# Altium schematic sheet SchematicFinal.SchDoc
size A4; SheetNumber: 1; SheetTotal: 2
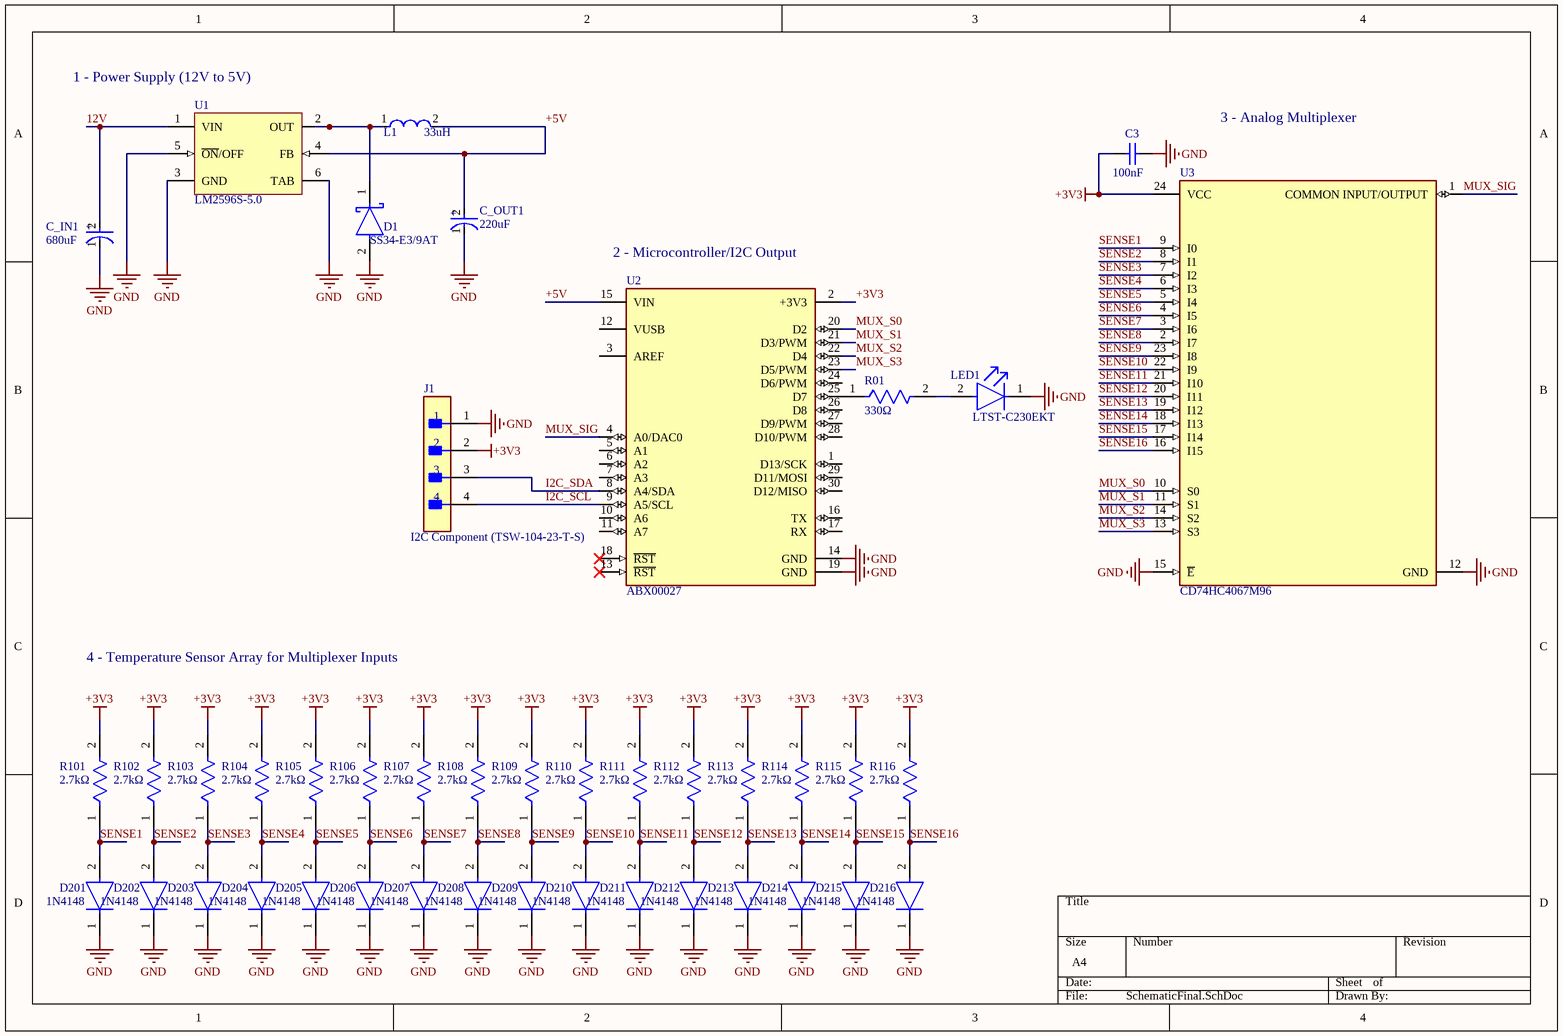
[diagram p0: SchematicFinal.SchDoc]

## Parts
C3  100nF  [CAPC1206(3216)170_M]
C_IN1  680uF  [FP-RAD-TH-D_10_0_5-L_12_5-MFG]
C_OUT1  220uF  [FP-227AVG035MFBJ-MFG]
D1  SS34-E3/9AT  [FP-SMC-MFG]
D201  1N4148  [FP-017AG-MFG]
D202  1N4148  [FP-017AG-MFG]
D203  1N4148  [FP-017AG-MFG]
D204  1N4148  [FP-017AG-MFG]
D205  1N4148  [FP-017AG-MFG]
D206  1N4148  [FP-017AG-MFG]
D207  1N4148  [FP-017AG-MFG]
D208  1N4148  [FP-017AG-MFG]
D209  1N4148  [FP-017AG-MFG]
D210  1N4148  [FP-017AG-MFG]
D211  1N4148  [FP-017AG-MFG]
D212  1N4148  [FP-017AG-MFG]
D213  1N4148  [FP-017AG-MFG]
D214  1N4148  [FP-017AG-MFG]
D215  1N4148  [FP-017AG-MFG]
D216  1N4148  [FP-017AG-MFG]
J1  I2C Component (TSW-104-23-T-S)  [FP-TSW-104-23-T-S-MFG]
L1  33uH  [FP-LB2016-1_6-0_2-IPC_B]
LED1  LTST-C230EKT  [FP-LTST-C230EKT-MFG]
R01  330Ω  [FP-AF0201-MFG]
R101  2.7kΩ  [FP-RT0603-MFG]
R102  2.7kΩ  [FP-RT0603-MFG]
R103  2.7kΩ  [FP-RT0603-MFG]
R104  2.7kΩ  [FP-RT0603-MFG]
R105  2.7kΩ  [FP-RT0603-MFG]
R106  2.7kΩ  [FP-RT0603-MFG]
R107  2.7kΩ  [FP-RT0603-MFG]
R108  2.7kΩ  [FP-RT0603-MFG]
R109  2.7kΩ  [FP-RT0603-MFG]
R110  2.7kΩ  [FP-RT0603-MFG]
R111  2.7kΩ  [FP-RT0603-MFG]
R112  2.7kΩ  [FP-RT0603-MFG]
R113  2.7kΩ  [FP-RT0603-MFG]
R114  2.7kΩ  [FP-RT0603-MFG]
R115  2.7kΩ  [FP-RT0603-MFG]
R116  2.7kΩ  [FP-RT0603-MFG]
U1  LM2596S-5.0  [KTT0005B_L]
U2  ABX00027  [FP-ABX00027-MFG]
U3  CD74HC4067M96  [FP-DW0024A-MFG]

## Nets
+3V3: C3.1 J1.2 R101.2 R102.2 R103.2 R104.2 R105.2 R106.2 R107.2 R108.2 R109.2 R110.2 R111.2 R112.2 R113.2 R114.2 R115.2 R116.2 U2.2(+3V3) U3.24(VCC)
GND: C3.2 C_IN1.1(C) C_OUT1.1(C) D1.2(A) D201.1(C) D202.1(C) D203.1(C) D204.1(C) D205.1(C) D206.1(C) D207.1(C) D208.1(C) D209.1(C) D210.1(C) D211.1(C) D212.1(C) D213.1(C) D214.1(C) D215.1(C) D216.1(C) J1.1 LED1.1(C) U1.3(GND) U1.5(~{ON}/OFF) U1.6(TAB) U2.14(GND) U2.19(GND) U3.12(GND) U3.15(~{E})
12V: C_IN1.2(A) U1.1(VIN)
+5V: C_OUT1.2(A) L1.2 U1.4(FB) U2.15(VIN)
I2C_SCL: J1.4 U2.9(A5/SCL)
I2C_SDA: J1.3 U2.8(A4/SDA)
MUX_S0: U2.20(D2) U3.10(S0)
MUX_S1: U2.21(D3/PWM) U3.11(S1)
MUX_S2: U2.22(D4) U3.14(S2)
MUX_S3: U2.23(D5/PWM) U3.13(S3)
MUX_SIG: U2.4(A0/DAC0) U3.1(COMMON_INPUT/OUTPUT)
SENSE1: D201.2(A) R101.1 U3.9(I0)
SENSE2: D202.2(A) R102.1 U3.8(I1)
SENSE3: D203.2(A) R103.1 U3.7(I2)
SENSE4: D204.2(A) R104.1 U3.6(I3)
SENSE5: D205.2(A) R105.1 U3.5(I4)
SENSE6: D206.2(A) R106.1 U3.4(I5)
SENSE7: D207.2(A) R107.1 U3.3(I6)
SENSE8: D208.2(A) R108.1 U3.2(I7)
SENSE9: D209.2(A) R109.1 U3.23(I8)
SENSE10: D210.2(A) R110.1 U3.22(I9)
SENSE11: D211.2(A) R111.1 U3.21(I10)
SENSE12: D212.2(A) R112.1 U3.20(I11)
SENSE13: D213.2(A) R113.1 U3.19(I12)
SENSE14: D214.2(A) R114.1 U3.18(I13)
SENSE15: D215.2(A) R115.1 U3.17(I14)
SENSE16: D216.2(A) R116.1 U3.16(I15)
NetD1_1: D1.1(C) L1.1 U1.2(OUT)
NetLED1_2: LED1.2(A) R01.2
NetR01_1: R01.1 U2.25(D7)

Not connected (* = marked no-connect by the designer): U2 1(D13/SCK) 3(AREF) 5(A1) 6(A2) 7(A3) 10(A6) 11(A7) 12(VUSB) 13(~{RST})* 16(TX) 17(RX) 18(~{RST})* 24(D6/PWM) 26(D8) 27(D9/PWM) 28(D10/PWM) 29(D11/MOSI) 30(D12/MISO)

## Notes on the sheet
- (near U1) 1 - Power Supply (12V to 5V)
- 3 - Analog Multiplexer
- (near U2) 2 - Microcontroller/I2C Output
- 4 - Temperature Sensor Array for Multiplexer Inputs
- (in symbol CMP-00087-58146014-1) +
- (in symbol CMP-05427-000694-1) +

## Library data of the parts
C3 = CMP-1037-04207-2: CAP 100nF 100V ±5% 1206 (3216 Metric) Thickness 1.7mm SMD; Case-Metric: 3216; Case-EIA: 1206; Tolerance: Â±5%; Rated Voltage: 100 V; Technology: SMT; Value: 100nF; Max Thickness: 1.7 mm
C_IN1 = CMP-05427-000694-1: Aluminum Electrolytic Capacitors (Radial Lead Type) AEC-Q200 Qualified 680uF ±20% 16V; Ripple Current: 900mA; Dielectric Material: Aluminium; Life (Hours): 4000Hour; Lead Diameter: 0.6mm; Impedance: 63mR; Radiation Hardening: No; Max Operating Temperature: 105°C; Packaging: Bulk; RoHS Compliant: Yes; Voltage Rating: 16V; Capacitance: 680uF; REACH SVHC: No SVHC; Mount: Through Hole; Termination: Radial; Construction: RADIAL; Height: 12.5mm; Tolerance: 20%; Lead Pitch: 5mm; Case/Package: Radial; Diameter: 10mm; Min Operating Temperature: -55°C; Voltage: 16V; Voltage Rating (DC): 16V; Series: FK Radial; Number of Pins: 2
C_OUT1 = CMP-00087-58146014-1: 227AVG035MFBJ AVG Series 35 V 220 uF 8 x 12 mm LS=3.5 mm Radial Aluminum Polymer Capacitor; Ripple Current: 2.95A; Life (Hours): 1500hours; Tolerance: 20%; Capacitance: 220µF; Voltage Rating (DC): 35V; Leakage Current: 1.54mA; ESR (Equivalent Series Resistance): 26mΩ; Dissipation Factor: 12%; Case/Package: Radial; Height: 13.5mm; NexarPartId: 58146014; Max Operating Temperature: 125°C; Min Operating Temperature: -55°C; RoHS: Non-Compliant; Voltage Rating: 35V
D1 = CMP-02539-000066-1: DIODE SCHOTTKY 40V 3A DO214AB; Peak Non-Repetitive Surge Current: 100A; Forward Voltage: 500mV; Element Configuration: Single; Max Reverse Current: 500uA; Case/Package: SMC; Radiation Hardening: No; Series: -; Max Surge Current: 100A; RoHS Compliant: Yes; Min Operating Temperature: -55°C; Average Rectified Current: 3A; Max Reverse Leakage Current: 500uA; Package Quantity: 3500; Max Reverse Voltage (DC): 40V; Forward Current: 3A; Packaging: Tape and Reel; Max Operating Temperature: 125°C; Max Repetitive Reverse Voltage (Vrrm): 40V; Number of Pins: 2; Mount: Surface Mount
D201-D216 = CMP-07163-000046-1: DIODE GEN PURP 100V 200MA DO35; Forward Voltage: 1V; Max Power Dissipation: 500mW; Max Reverse Current: 5uA; Forward Current: 300mA; Current: 4A; Reverse Recovery Time: 4ns; Element Configuration: Single; Outside Diameter: 1.85mm; Capacitance: 4pF; Polarity: Standard; Max Forward Surge Current (Ifsm): 1A; Reverse Voltage: 100V; Output Current: 200mA; Average Rectified Current: 200mA; Diameter: 1.91mm; Max Repetitive Reverse Voltage (Vrrm): 100V; Current Rating: 200mA; Case/Package: DO-35; Lead Free: Lead Free; Number of Pins: 2; Recovery Time: 4ns; Packaging: Bulk; Contact Plating: Tin; Voltage: 100V; Mount: Through Hole; Max Surge Current: 4A; Package Quantity: 2000; Width: 1.91mm; Max Reverse Voltage (DC): 100V; Length: 4.56mm; Radiation Hardening: No; Power Dissipation: 500mW; Voltage Rating (DC): 100V; Peak Non-Repetitive Surge Current: 4A; REACH SVHC: No SVHC; Height: 4.56mm; Max Operating Temperature: 175°C; Series: -; Weight: 0.01lb; Min Operating Temperature: -65°C
J1 = CMP-02766-001388-1: CONN HEADER VERT 4POS 2.54MM; Number of Contacts: 4; Gender: Male; Connector Type: Male Pin; Max Voltage Rating (AC): 550V; Max Current Rating: 7.6A; Radiation Hardening: No; Lead Free: Lead Free; RoHS Compliant: Yes; Contact Material: Bronze; Number of Positions: 4; Housing Color: Black; Min Operating Temperature: -55°C; Mount: Through Hole; Number of Rows: 1; Orientation: Straight; Contact Mating Length: 0.23inch; Contact Type: Male Pin; REACH SVHC: No SVHC; Max Operating Temperature: 105°C; Color: Black; Pitch: 2.54mm; Length: 10.16mm; Series: TSW; Packaging: Bulk; Contact Plating: Tin; Package Quantity: 1; Termination: Solder; Housing Material: Polyester; Width: 2.54mm; Depth: 2.54mm
L1 = CMP-14484-000618-1: SMD Inductors 33uH ±10% 0.135A 3.64Ω 0806; Shielding: Unshielded; Core Material: Ferrite; DC Resistance (DCR): 3.64R; Test Frequency: 2.52MHz; Max DC Current: 135mA; Self Resonant Frequency: 14MHz; Case/Package: 0806; Width: 0.049inch; Package Quantity: 2000; Inductance: 33uH; Min Operating Temperature: -25°C; Height: 0.049inch; Depth: 1.8mm; Termination: SMD/SMT; Inductance Tolerance: 10%; Case Code (Imperial): 0806; Current Rating: 135mA; Halogen Free: Halogen Free; Max Operating Temperature: 105°C; Tolerance: 10%; Radiation Hardening: No; Case Code (Metric): 2016; RoHS Compliant: Yes; Series: LB; Mount: Surface Mount; Length: 0.079inch; Lead Free: Lead Free; Packaging: Tape and Reel
LED1 = CMP-22017-000030-1: LED RED CLEAR CHIP SMD; Forward Current: 30mA; Test Current: 10mA; Number of Elements: 1; Viewing Angle: 130°; Dominant Wavelength: 621nm; Forward Voltage: 2V; Lens Style: Diffused; Power Rating: 100mW; Reverse Voltage: 5V; Wavelength: 630nm; Luminous Intensity: 6mcd; Lens Color: Colorless; Case/Package: 1206; Case Code (Imperial): 1206; Package Quantity: 1; Lead Free: Lead Free; Case Code (Metric): 3216; Height: 1.1mm; Lens Transparency: Clear; Mount: Surface Mount; Depth: 1.6mm; Number of LEDs: 1; Power Dissipation: 100mW; Max Operating Temperature: 85°C; Width: 1.6mm; Color: Red; Number of Pins: 2; Min Operating Temperature: -55°C; Packaging: Tape and Reel; Radiation Hardening: No; Illumination Color: Red; Length: 3.2mm
R01 = CMP-03412-043091-1: Anti-Sulfurated Chip Resistors Automotive Grade 330Ω 1% 200ppm/°C 0201; Max Power Dissipation: 50mW; Resistance: 330R; Series: AF; Tolerance: 1%; Resistor Type: Thick Film; Packaging: Tape and Reel; Features: Moisture Resistant; Temperature Coefficient: 200ppm/°C; Number of Terminations: 2; Max Operating Temperature: 125°C; Length: 0.024inch; RoHS Compliant: Yes; Width: 0.012inch; Min Operating Temperature: -55°C; Height: 0.01inch; Case/Package: 0201
R101-R116 = CMP-03412-020573-1: RES SMD 2.7K OHM 0.5% 1/10W 0603; Manufacturer: Yageo; Manufacturer Part Number: RT0603DRE072K7L; Tolerance: 0.005; Power Rating: 0.1W; Voltage Rating: 75V; Temperature Coefficient: 50 ppm/°C; Device Class L1: Passive Components; Mouser Description: Thin Film Resistors - SMD 1/10W 2.7K ohm .5% 50ppm; Package: RT0603; ComponentLink2Description: Datasheet; ComponentLink2URL: http://www.yageo.com/documents/recent/PYu-RT_1-to-0.01_RoHS_L_9.pdf; Device Class L2: Resistors; Category: Res; Temperature Range Low: -55°C; Composition: Thin Film; Octopart: https://octopart.com/rt0603dre072k7l-yageo-1479868; Resistance: 2.7KΩ; Ipc Land Pattern Name: RESC16080X45; Series: RT; Digikey Description: RES SMD 2.7K OHM 0.5% 1/10W 0603; Temperature: -55°C to +155°C; Footprint Url: http://www.yageo.com/exep/pages/download/literatures/PYu-R_Mount_10.pdf; Temperature Range High: +155°C; RoHS: TRUE; Automotive: No; Height: 0.55mm; Device Class L3: Chip SMD Resistors; Value: 2.7KΩ; Lead Free: Yes
U1 = CMP-0069-00270-3: SIMPLE SWITCHER® Power Converter 150 KHz 3A Step-Down Voltage Regulator, 5-pin TO-263; Manufacturer: Texas Instruments; PowerWise: N; PackageTopMarking: NSUZXYTTE#*LM2596S*-5.0 P+; RoHS: N; Code_JEDEC: MO-169-AB; PackageDescription: TO-263, Molded, .400 x .390 x .180in, 5 Lead, .067in Pitch, Surface Mount; PinCount: 5; PackageReference: KTT0005B; CompType: Switcher; ComponentLink1URL: http://www.ti.com/general/docs/lit/getliterature.tsp?genericPartNumber=LM2596&fileType=pdf; ComponentLink1Description: Datasheet URL
U2 = CMP-189990-000001-1: ARDUINO NANO 33 IOT; Number Of Usb Channels: 1; Memory Size: 256KBytes; Interface: I2C,SPI,UART,USB,Other; Number Of Timers/Counters: 5; Memory Type: FLASH; Frequency: 48MHz; Data Bus Width: 32bits; Number Of I/Os: 23; Min Supply Voltage: 4.5V; Core Architecture: ARM Cortex-M0+; Ram Size: 32KBytes; Number Of Adc Channels: 8; Max Supply Voltage: 21V; Manufacturer Part Number: ABX00027; RoHS: TRUE; Automotive: No; Footprint Url: https://content.arduino.cc/assets/Nano33IoT.zip; Number Of A/D Converters: 1; Device Class L3: Microcontrollers; Manufacturer: Arduino; Number Of Spi Channels: 1; Ipc Land Pattern Name: DFN4400X1778X80-30; Category: IC; Number Of Cores: 1; Package: 0; ComponentLink2URL: https://store.arduino.cc/arduino-nano-33-iot; ComponentLink2Description: Datasheet; Digikey Description: ARDUINO NANO 33 IOT; Number Of Uart Channels: 1; Lead Free: Yes; Address Bus Width: 32bits; Device Class L2: Embedded Processors and Controllers; Octopart: https://octopart.com/abx00027-arduino-102769437; Number Of Pwm Channels: 5; Number Of I2C Channels: 1; Device Class L1: Integrated Circuits (ICs)
U3 = CMP-04901-000007-1: IC MUX/DEMUX 1X16 24SOIC; Manufacturer: Texas Instruments; Standoff Height: 0.1mm; Logic Function Desc: Non-Inverting; Max Supply Voltage: 6V; Number Of Inputs: 16; Quiescent Current: 8uA; Number Of Circuits: 1; Propagation Delay: 6ns; Max Junction Temp: +150°C; Min Supply Voltage: 2V; ComponentLink2Description: Datasheet; Octopart: https://octopart.com/cd74hc4067m96-texas+instruments-722802; Ambient Temperature Range High: +125°C; Ipc Land Pattern Name: SOIC127P1030X265-24; Height: 2.65mm; Mouser Description: Multiplexer Switch ICs Hi-Spd CMOS 16Ch Anl Mltplxr/Demltplxr; Temperature Range Low: -55°C; Package: DW0024A; Temperature Range High: +125°C; Lead Free: Yes; ComponentLink2URL: http://www.ti.com/lit/ds/symlink/cd74hc4067.pdf; Manufacturer Part Number: CD74HC4067M96; RoHS: TRUE; Automotive: No; Device Class L1: Integrated Circuits (ICs); Digikey Description: IC MUX/DEMUX 1X16 24SOIC; Device Class L2: Logic ICs; Temperature: -55°C to +125°C; Device Class L3: Multiplexers; Category: IC; Ambient Temperature Range Low: -55°C; Number Of Outputs: 1